# Altium schematic sheet Mainboard.SchDoc
size A3; SheetNumber: 1; SheetTotal: 5
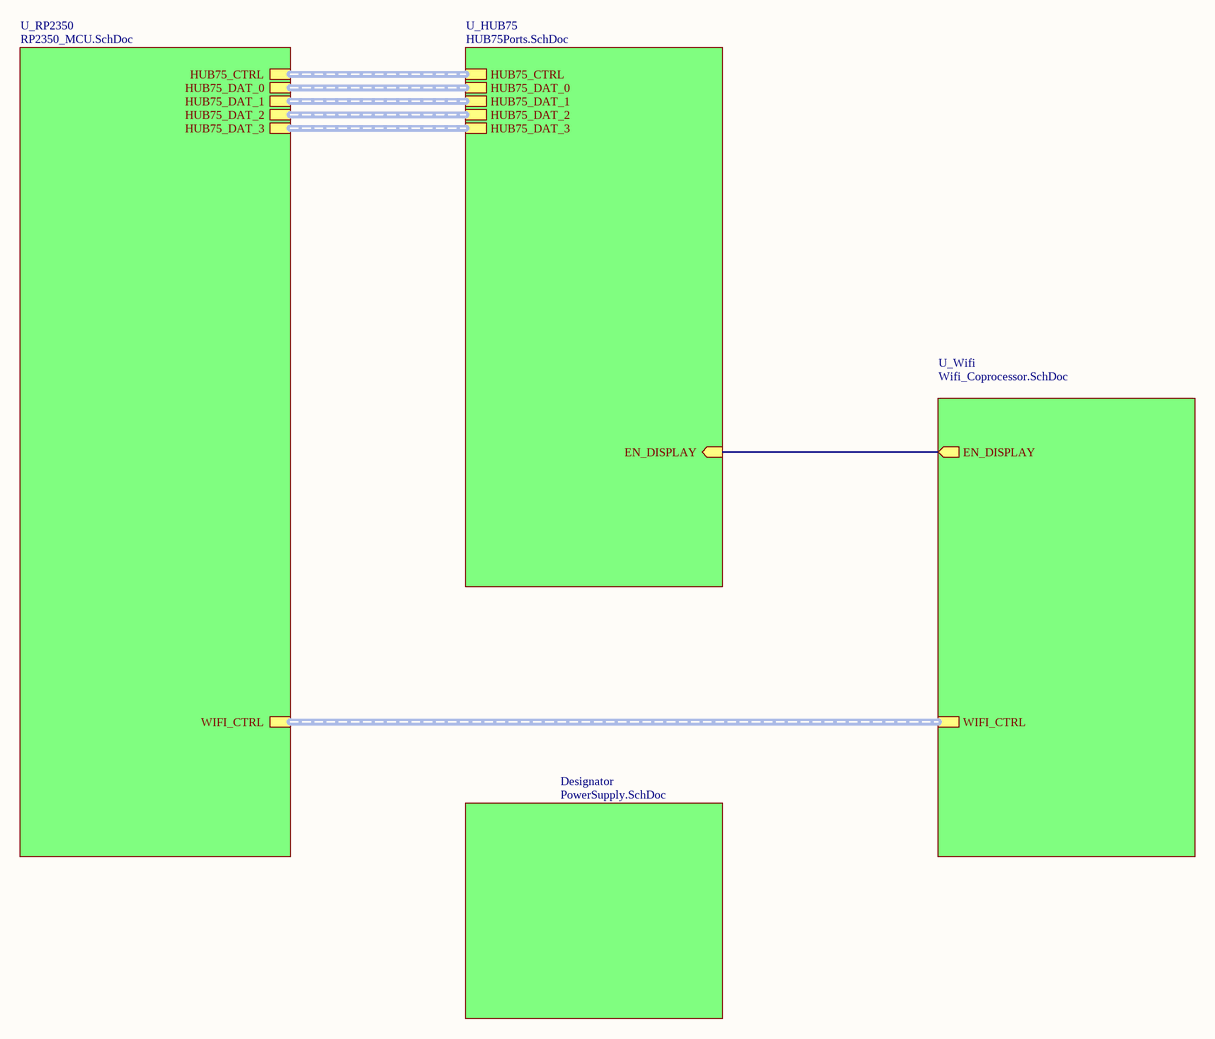
[diagram p0: Mainboard.SchDoc]

## Sub-sheets
Designator = PowerSupply.SchDoc: no entries
U_HUB75 = HUB75Ports.SchDoc: HUB75_CTRL (harness HUB75_CTRL), HUB75_DAT_0 (harness HUB75_DAT_0), HUB75_DAT_1 (harness HUB75_DAT_1), HUB75_DAT_2 (harness HUB75_DAT_2), HUB75_DAT_3 (harness HUB75_DAT_3), EN_DISPLAY (in)
U_RP2350 = RP2350_MCU.SchDoc: HUB75_CTRL (harness HUB75_CTRL), WIFI_CTRL (harness WIFI_CTRL), HUB75_DAT_0 (harness HUB75_DAT_0), HUB75_DAT_2 (harness HUB75_DAT_2), HUB75_DAT_3 (harness HUB75_DAT_3), HUB75_DAT_1 (harness HUB75_DAT_1)
U_Wifi = Wifi_Coprocessor.SchDoc: WIFI_CTRL (harness WIFI_CTRL), EN_DISPLAY (out)

## Nets
(unnamed): sheet U_HUB75/EN_DISPLAY, sheet U_Wifi/EN_DISPLAY

## Buses and harness runs
harness sheet U_HUB75/HUB75_CTRL = sheet U_RP2350/HUB75_CTRL
harness sheet U_HUB75/HUB75_DAT_0 = sheet U_RP2350/HUB75_DAT_0
harness sheet U_HUB75/HUB75_DAT_1 = sheet U_RP2350/HUB75_DAT_1
harness sheet U_HUB75/HUB75_DAT_2 = sheet U_RP2350/HUB75_DAT_2
harness sheet U_HUB75/HUB75_DAT_3 = sheet U_RP2350/HUB75_DAT_3
harness sheet U_RP2350/WIFI_CTRL = sheet U_Wifi/WIFI_CTRL